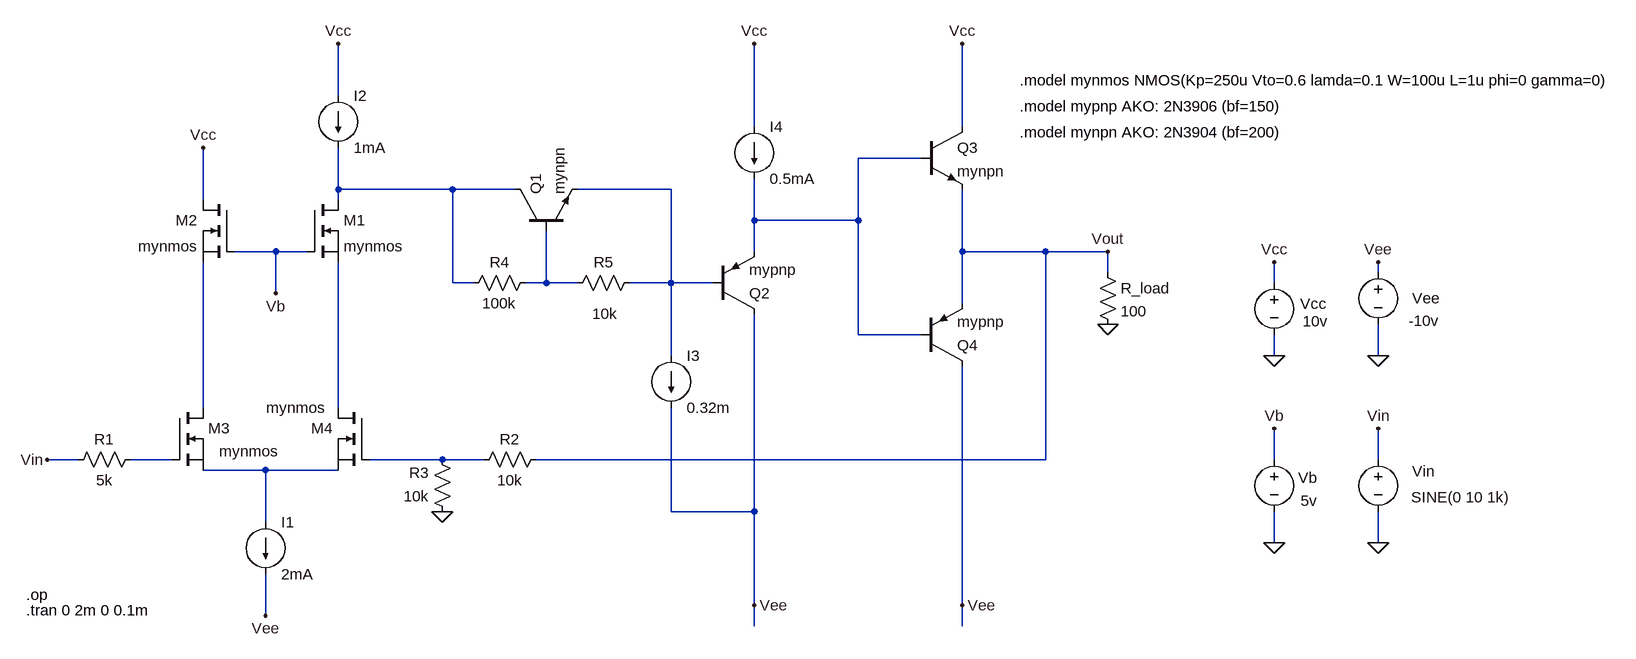
[diagram p0: schematic 9_spice.asc]
9_spice.asc, the LTspice schematic file:
Version 4
SHEET 1 2852 1884
WIRE 464 -192 464 -272
WIRE 1104 -144 1104 -272
WIRE 1424 -144 1424 -272
WIRE 1360 -96 1264 -96
WIRE 464 -48 464 -112
WIRE 640 -48 464 -48
WIRE 736 -48 640 -48
WIRE 976 -48 832 -48
WIRE 256 -32 256 -112
WIRE 464 -32 464 -48
WIRE 1104 0 1104 -64
WIRE 1264 0 1264 -96
WIRE 1264 0 1104 0
WIRE 368 48 304 48
WIRE 416 48 368 48
WIRE 1104 48 1104 0
WIRE 1424 48 1424 -48
WIRE 1552 48 1424 48
WIRE 1648 48 1552 48
WIRE 1648 80 1648 48
WIRE 2064 80 2064 64
WIRE 640 96 640 -48
WIRE 672 96 640 96
WIRE 784 96 784 16
WIRE 784 96 752 96
WIRE 832 96 784 96
WIRE 976 96 976 -48
WIRE 976 96 912 96
WIRE 1040 96 976 96
WIRE 1904 96 1904 64
WIRE 368 112 368 48
WIRE 1424 128 1424 48
WIRE 1264 176 1264 0
WIRE 1360 176 1264 176
WIRE 976 208 976 96
WIRE 1904 208 1904 176
WIRE 2064 208 2064 160
WIRE 256 288 256 64
WIRE 464 288 464 64
WIRE 64 368 16 368
WIRE 208 368 144 368
WIRE 624 368 512 368
WIRE 688 368 624 368
WIRE 1552 368 1552 48
WIRE 1552 368 768 368
WIRE 1904 368 1904 320
WIRE 2064 368 2064 320
WIRE 352 384 256 384
WIRE 464 384 352 384
WIRE 976 448 976 288
WIRE 1104 448 1104 144
WIRE 1104 448 976 448
WIRE 352 464 352 384
WIRE 1904 496 1904 448
WIRE 2064 496 2064 448
WIRE 1104 592 1104 448
WIRE 1424 592 1424 224
WIRE 352 608 352 544
WIRE 1104 624 1104 592
WIRE 1424 624 1424 592
FLAG 1648 160 0
FLAG 1904 208 0
FLAG 2064 208 0
FLAG 1904 496 0
FLAG 1904 64 Vcc
FLAG 2064 64 Vee
FLAG 1904 320 Vb
FLAG 368 112 Vb
FLAG 464 -272 Vcc
FLAG 624 448 0
FLAG 1104 592 Vee
FLAG 1648 48 Vout
FLAG 16 368 Vin
FLAG 2064 496 0
FLAG 2064 320 Vin
FLAG 256 -112 Vcc
FLAG 1104 -272 Vcc
FLAG 1424 -272 Vcc
FLAG 1424 592 Vee
FLAG 352 608 Vee
SYMBOL nmos 416 -32 R0
SYMATTR InstName M1
SYMATTR Value mynmos
SYMBOL nmos 304 -32 M0
SYMATTR InstName M2
SYMATTR Value mynmos
SYMBOL nmos 208 288 R0
WINDOW 3 73 67 Left 2
SYMATTR Value mynmos
SYMATTR InstName M3
SYMBOL nmos 512 288 M0
WINDOW 3 67 0 Left 2
SYMATTR Value mynmos
SYMATTR InstName M4
SYMBOL res 160 352 R90
WINDOW 0 0 56 VBottom 2
WINDOW 3 32 56 VTop 2
SYMATTR InstName R1
SYMATTR Value 5k
SYMBOL res 640 464 R180
WINDOW 0 36 76 Left 2
WINDOW 3 36 40 Left 2
SYMATTR InstName R3
SYMATTR Value 10k
SYMBOL current 352 464 R0
WINDOW 123 0 0 Left 0
WINDOW 39 0 0 Left 0
SYMATTR InstName I1
SYMATTR Value 2mA
SYMBOL current 464 -192 R0
WINDOW 123 0 0 Left 0
WINDOW 39 0 0 Left 0
SYMATTR InstName I2
SYMATTR Value 1mA
SYMBOL npn 736 16 R270
SYMATTR InstName Q1
SYMATTR Value mynpn
SYMBOL res 768 80 R90
WINDOW 0 0 56 VBottom 2
WINDOW 3 32 56 VTop 2
SYMATTR InstName R4
SYMATTR Value 100k
SYMBOL res 928 80 R90
WINDOW 0 0 56 VBottom 2
WINDOW 3 48 54 VTop 2
SYMATTR InstName R5
SYMATTR Value 10k
SYMBOL pnp 1040 144 M180
SYMATTR InstName Q2
SYMATTR Value mypnp
SYMBOL npn 1360 -144 R0
SYMATTR InstName Q3
SYMATTR Value mynpn
SYMBOL pnp 1360 224 M180
SYMATTR InstName Q4
SYMATTR Value mypnp
SYMBOL current 976 208 R0
WINDOW 123 0 0 Left 0
WINDOW 39 0 0 Left 0
SYMATTR InstName I3
SYMATTR Value 0.32m
SYMBOL current 1104 -144 R0
WINDOW 123 0 0 Left 0
WINDOW 39 0 0 Left 0
SYMATTR InstName I4
SYMATTR Value 0.5mA
SYMBOL res 1632 64 R0
SYMATTR InstName R_load
SYMATTR Value 100
SYMBOL voltage 1904 80 R0
WINDOW 123 0 0 Left 0
WINDOW 39 0 0 Left 0
WINDOW 0 40 48 Left 2
WINDOW 3 44 75 Left 2
SYMATTR InstName Vcc
SYMATTR Value 10v
SYMBOL voltage 2064 64 R0
WINDOW 123 0 0 Left 0
WINDOW 39 0 0 Left 0
WINDOW 0 52 56 Left 2
WINDOW 3 47 90 Left 2
SYMATTR InstName Vee
SYMATTR Value -10v
SYMBOL voltage 1904 352 R0
WINDOW 123 0 0 Left 0
WINDOW 39 0 0 Left 0
WINDOW 0 37 44 Left 2
WINDOW 3 41 79 Left 2
SYMATTR InstName Vb
SYMATTR Value 5v
SYMBOL voltage 2064 352 R0
WINDOW 123 24 44 Left 2
WINDOW 39 0 0 Left 0
WINDOW 3 51 74 Left 2
WINDOW 0 52 34 Left 2
SYMATTR Value SINE(0 10 1k)
SYMATTR InstName Vin
SYMBOL res 784 352 R90
WINDOW 0 0 56 VBottom 2
WINDOW 3 32 56 VTop 2
SYMATTR InstName R2
SYMATTR Value 10k
TEXT 1512 -176 Left 2 !.model mypnp AKO: 2N3906 (bf=150)
TEXT 1512 -136 Left 2 !.model mynpn AKO: 2N3904 (bf=200)
TEXT 1512 -216 Left 2 !.model mynmos NMOS(Kp=250u Vto=0.6 lamda=0.1 W=100u L=1u phi=0 gamma=0)
TEXT -16 576 Left 2 !.op
TEXT -16 600 Left 2 !.tran 0 2m 0 0.1m

The netlist it stands for:
* 9_spice.asc
M1 N002 Vb N006 N006 mynmos
M2 Vcc Vb N005 N005 mynmos
M3 N005 N007 N009 N009 mynmos
M4 N006 N008 N009 N009 mynmos
R1 N007 Vin 5k
R3 0 N008 10k
I1 N009 Vee 2mA
I2 Vcc N002 1mA
Q1 N002 N004 N003 0 mynpn
R4 N004 N002 100k
R5 N003 N004 10k
Q2 Vee N003 N001 0 mypnp
Q3 Vcc N001 Vout 0 mynpn
Q4 Vee N001 Vout 0 mypnp
I3 N003 Vee 0.32m
I4 Vcc N001 0.5mA
R_load Vout 0 100
Vcc Vcc 0 10v
Vee Vee 0 -10v
Vb Vb 0 5v
Vin Vin 0 SINE(0 10 1k)
R2 Vout N008 10k
.model NPN NPN
.model PNP PNP
.lib standard.bjt
.model NMOS NMOS
.model PMOS PMOS
.lib standard.mos
.model mypnp AKO: 2N3906 (bf=150)
.model mynpn AKO: 2N3904 (bf=200)
.model mynmos NMOS(Kp=250u Vto=0.6 lamda=0.1 W=100u L=1u phi=0 gamma=0)
.op
.tran 0 2m 0 0.1m
.backanno
.end